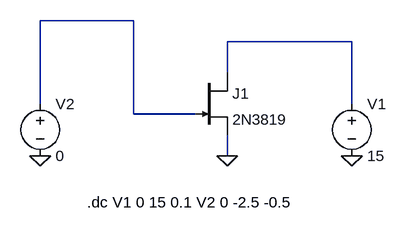
[diagram p0: schematic JFET_Output_Characteristics.asc]
JFET_Output_Characteristics.asc, the LTspice schematic file:
Version 4.1
SHEET 1 880 680
WIRE 304 80 160 80
WIRE 640 112 448 112
WIRE 448 160 448 112
WIRE 160 208 160 80
WIRE 640 208 640 112
WIRE 304 224 304 80
WIRE 400 224 304 224
WIRE 448 288 448 256
FLAG 448 288 0
FLAG 160 288 0
FLAG 640 288 0
SYMBOL njf 400 160 R0
SYMATTR InstName J1
SYMATTR Value 2N3819
SYMBOL voltage 640 192 R0
SYMATTR InstName V1
SYMATTR Value 15
SYMBOL voltage 160 192 R0
SYMATTR InstName V2
SYMATTR Value 0
TEXT 232 360 Left 2 !.dc V1 0 15 0.1 V2 0 -2.5 -0.5

The netlist it stands for:
* JFET_Output_Characteristics.asc
J1 N002 N001 0 2N3819
V1 N002 0 15
V2 N001 0 0
.model NJF NJF
.model PJF PJF
.lib standard.jft
.dc V1 0 15 0.1 V2 0 -2.5 -0.5
.backanno
.end